# EasyEDA Pro project wzh2814685-voltpen_v0-5-3f4d7379.epro, schematic 主控板原理图
Board Name: 主控板; Create Date: 2025-03-02; Page Name: 原理图; Project Name: 多快充协议多发热芯兼容的诱骗器/焊笔一体化应用工具VoltPen; Schematic Name: 主控板原理图; Update Date: 2025-04-19; Add into BOM: yes; Company: Your Company; Convert to PCB: yes; Date: 2025-03-02; Draw By: weifangluntan; REV: 1.0; Sheet: 1/1
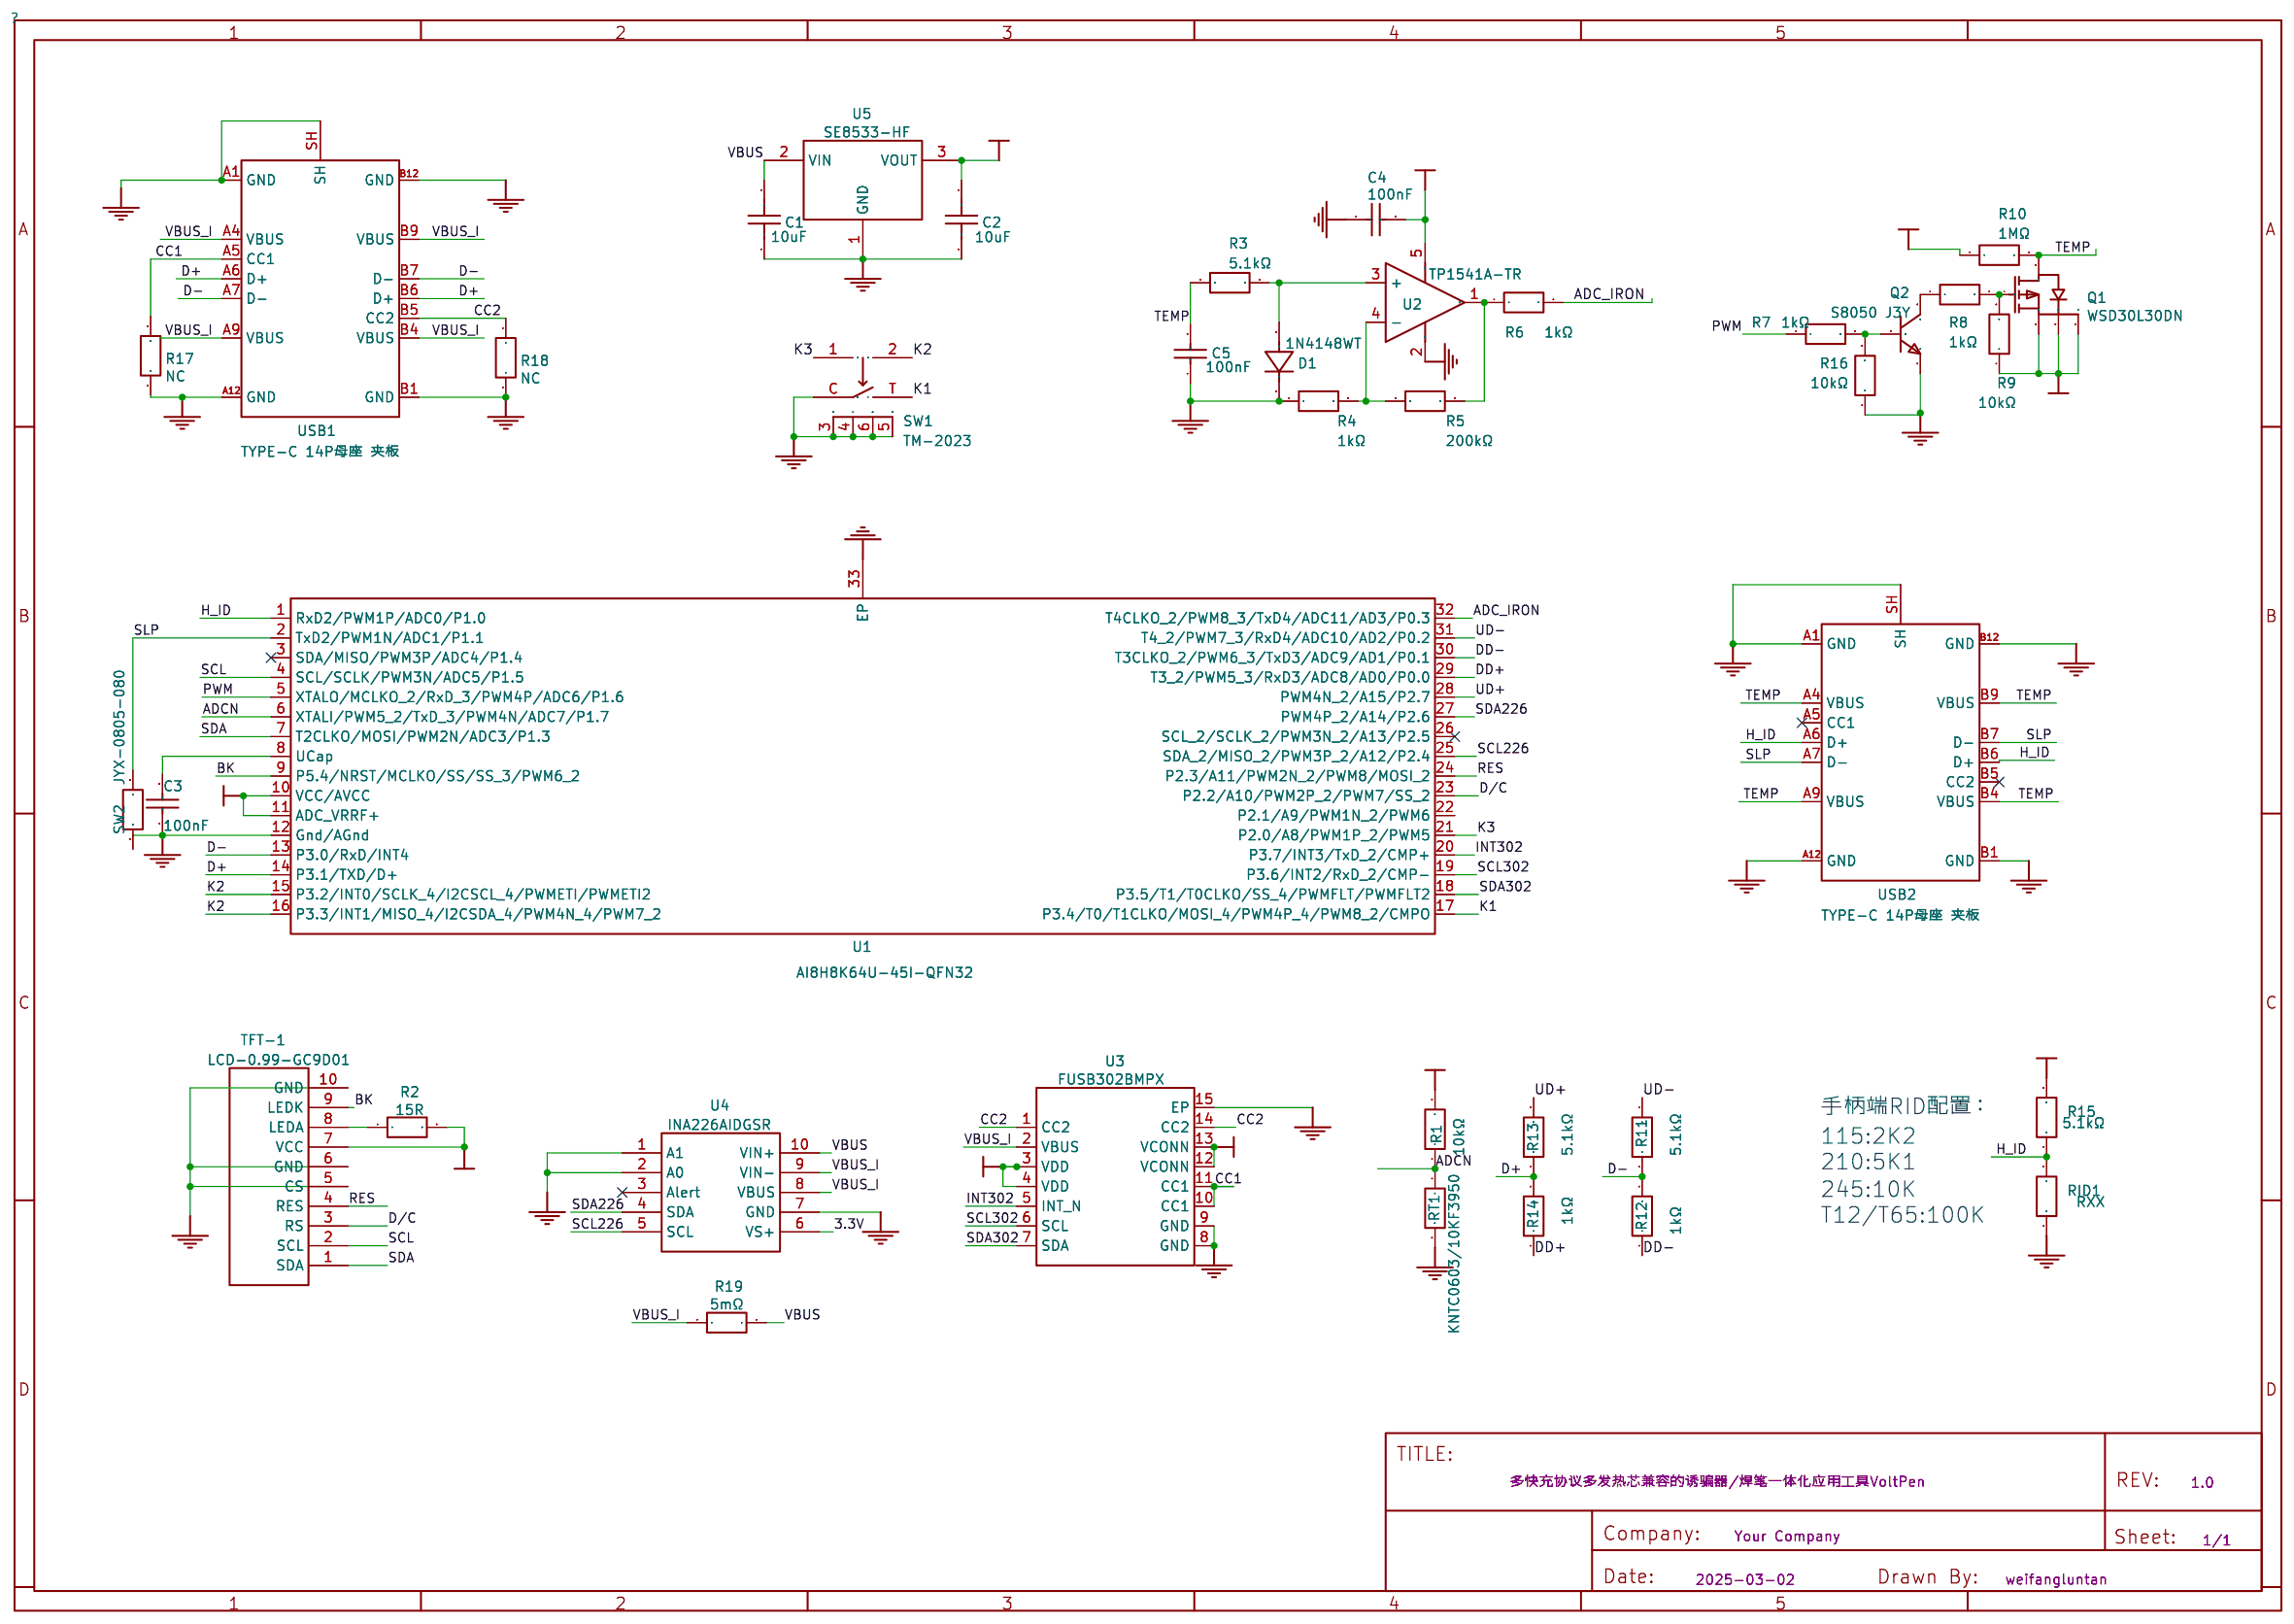
[diagram p0: schematic sheet]

## Parts
C1  10uF  [C0603]
C2  10uF  [C0402]
C3  100nF  [C0402]
C4  100nF  [C0402]
C5  100nF  [C0402]
D1  1N4148WT  [SOD-523_L1.2-W0.8-LS1.6-FD]
Q1  WSD30L30DN  [WDFN-8_L3.3-W3.3-P0.65-BL]
Q2  S8050 J3Y  [SOT-23-3_L2.9-W1.3-P1.90-LS2.4-BR]
R1  10kΩ  [R0402]
R2  15R  [R0402]
R3  5.1kΩ  [R0402]
R4  1kΩ  [R0402]
R5  200kΩ  [R0402]
R6  1kΩ  [R0402]
R7  1kΩ  [R0402]
R8  1kΩ  [R0402]
R9  10kΩ  [R0402]
R10  1MΩ  [R0402]
R11  5.1kΩ  [R0402]
R12  1kΩ  [R0402]
R13  5.1kΩ  [R0402]
R14  1kΩ  [R0402]
R15  5.1kΩ  [R0402]
R16  10kΩ  [R0402]
R17  NC  [R0402]
R18  NC  [R0402]
R19  5mΩ  [R2512]
RID1  RXX  [R0402]  (no BOM)
RT1  KNTC0603/10KF3950  [R0603]
SW1  TM-2023  [SW-SMD_TM-2023-1]
SW2  JYX-0805-080  [R0805]  (no BOM)
TFT-1  LCD-0.99-GC9D01  [0.99寸-GC9D01N]
U1  AI8H8K64U-45I-QFN32  [QFN-32_L4.0-W4.0-P0.40-TL-EP2.7-1]
U2  TP1541A-TR  [SOT-23-5_L3.0-W1.7-P0.95-LS2.8-BR]
U3  FUSB302BMPX  [MLP-14_L2.5-W2.5-P0.50-BL-EP]
U4  INA226AIDGSR  [MSOP-10_L3.0-W3.0-P0.50-LS5.0-BL]
U5  SE8533-HF  [SOT-89-3_L4.5-W2.5-P1.50-LS4.2-BR]
USB1  TYPE-C 14P母座 夹板  [TYPE-C 14P母座]
USB2  TYPE-C 14P母座 夹板  [TYPE-C 14P母座]

## Library data of the parts
C1 = GRM188R6YA106MA73D: 容值:10uF;精度:±20%;额定电压:35V;材质(温度系数):X5R;; LCSC Part Name: 10uF ±20% 35V; Supplier Part: C194427; Manufacturer: muRata(村田); Supplier Footprint: 0603; JLCPCB Part Class: Extended Part; Datasheet: https://atta.szlcsc.com/upload/public/pdf/source/20210128/C194427_FCA3640823207DDB58700A82F1A19B5F.pdf; Supplier: LCSC; Tolerance: ±20%; Voltage Rated: 35V; Temperature Coefficient: X5R
C2 = CL05A106MQ5NUNC: 容值:10uF;精度:±20%;额定电压:6.3V;材质(温度系数):X5R;; LCSC Part Name: 10uF ±20% 6.3V; Supplier Part: C15525; Manufacturer: SAMSUNG(三星); Supplier Footprint: 0402; JLCPCB Part Class: Basic Part; Datasheet: https://atta.szlcsc.com/upload/public/pdf/source/20220823/2B02EE04F8F211D38A52DCB16EB6BEBA.pdf; Supplier: LCSC; Tolerance: ±20%; Voltage Rated: 6.3V; Temperature Coefficient: X5R
C3-C5 = CL05B104KB54PNC: 容值:100nF;精度:±10%;额定电压:50V;材质(温度系数):X7R;; LCSC Part Name: 100nF ±10% 50V; Supplier Part: C307331; Manufacturer: SAMSUNG(三星); Supplier Footprint: 0402; JLCPCB Part Class: Basic Part; Datasheet: https://atta.szlcsc.com/upload/public/pdf/source/20160218/1457707763339.pdf; Supplier: LCSC; Tolerance: ±10%; Voltage Rated: 50V; Temperature Coefficient: X7R
D1 = 1N4148WT_C7420320: 二极管配置:独立式;正向压降(Vf):1.25V@150mA;直流反向耐压(Vr):100V;整流电流:150mA;反向恢复时间(trr):4ns;; Supplier Part: C7420320; Manufacturer: 宏迦橙; Supplier Footprint: SOD-523; JLCPCB Part Class: Extended Part; Datasheet: https://atta.szlcsc.com/upload/public/pdf/source/20231117/D000C709FE20996E10C70AE097E7AADF.pdf; Supplier: LCSC; Diode Configuration: 独立式; Forward Voltage (Vf@If): 1.25V@150mA; Reverse Voltage (Vr): 100V; Rectified Current: 150mA; Reverse Leakage Current (Ir): 1uA@75V; Reverse Recovery Time (trr): 4ns; Operating Temperature: -55℃~+150℃
Q1 = WSD30L30DN: Supplier: LCSC; Supplier Part: C719099; Manufacturer: WINSOK(微硕); Manufacturer Part: WSD30L30DN33; JLCPCB Part Class: Extended Part
Q2 = S8050 J3Y(RANGE:200-350): 晶体管类型:NPN;集电极电流(Ic):500mA;集射极击穿电压(Vceo):25V;耗散功率(Pd):300mW;直流电流增益(hFE):200@500mA,1V;; LCSC Part Name: H档(200-350); Supplier Part: C2146; Manufacturer: CJ(江苏长电/长晶); Supplier Footprint: SOT-23; JLCPCB Part Class: Basic Part; Datasheet: https://atta.szlcsc.com/upload/public/pdf/source/20231013/FF37B6A000E6CDA75C9C999D2E78731F.pdf; Supplier: LCSC; type: NPN; Current - Collector(Ic): 500mA; Collector - Emitter Voltage VCEO: 25V; Pd - Power Dissipation: 300mW; DC Current Gain: 200@500mA,1V; Transition frequency(fT): 150MHz; Current - Collector Cutoff: 100nA; Vce Saturation(VCE(sat)): 600mV; Operating Temperature: -55℃~+150℃
R1 R9 R16 = 0402WGF1002TCE: 电阻类型:厚膜电阻;阻值:10kΩ;精度:±1%;功率:62.5mW;最大工作电压:50V;温度系数:±100ppm/℃;; LCSC Part Name: 10kΩ ±1% 62.5mW 厚膜电阻; Supplier Part: C25744; Manufacturer: UNI-ROYAL(厚声); Supplier Footprint: 0402; JLCPCB Part Class: Basic Part; Datasheet: https://atta.szlcsc.com/upload/public/pdf/source/20200306/C422600_1E6D84923E4A46A82E41ADD87F860B5C.pdf; Supplier: LCSC; Type: 厚膜电阻; Tolerance: ±1%; Power(Watts): 62.5mW; Overload Voltage (Max): 50V; Temperature Coefficient: ±100ppm/℃; Operating Temperature Range: -55℃~+155℃
R2 = 15R
R3 R11 R13 R15 R17 R18 = 0402WGF5101TCE: 电阻类型:厚膜电阻;阻值:5.1kΩ;精度:±1%;功率:62.5mW;最大工作电压:50V;温度系数:±100ppm/℃;; LCSC Part Name: 5.1kΩ ±1% 62.5mW 厚膜电阻; Supplier Part: C25905; Manufacturer: UNI-ROYAL(厚声); Supplier Footprint: 0402; JLCPCB Part Class: Basic Part; Datasheet: https://atta.szlcsc.com/upload/public/pdf/source/20200306/C422600_1E6D84923E4A46A82E41ADD87F860B5C.pdf; Supplier: LCSC; Type: 厚膜电阻; Tolerance: ±1%; Power(Watts): 62.5mW; Overload Voltage (Max): 50V; Temperature Coefficient: ±100ppm/℃; Operating Temperature Range: -55℃~+155℃
R4 R6-R8 R12 R14 = 0402WGF1001TCE: 电阻类型:厚膜电阻;阻值:1kΩ;精度:±1%;功率:62.5mW;最大工作电压:50V;温度系数:±100ppm/℃;; LCSC Part Name: 1kΩ ±1% 62.5mW 厚膜电阻; Supplier Part: C11702; Manufacturer: UNI-ROYAL(厚声); Supplier Footprint: 0402; JLCPCB Part Class: Basic Part; Datasheet: https://atta.szlcsc.com/upload/public/pdf/source/20200306/C422600_1E6D84923E4A46A82E41ADD87F860B5C.pdf; Supplier: LCSC; Type: 厚膜电阻; Tolerance: ±1%; Power(Watts): 62.5mW; Overload Voltage (Max): 50V; Temperature Coefficient: ±100ppm/℃; Operating Temperature Range: -55℃~+155℃
R5 = 0402WGF2003TCE: 电阻类型:厚膜电阻;阻值:200kΩ;精度:±1%;功率:62.5mW;最大工作电压:50V;温度系数:±100ppm/℃;; LCSC Part Name: 200kΩ ±1% 62.5mW 厚膜电阻; Supplier Part: C25764; Manufacturer: UNI-ROYAL(厚声); Supplier Footprint: 0402; JLCPCB Part Class: Basic Part; Datasheet: https://atta.szlcsc.com/upload/public/pdf/source/20200306/C422600_1E6D84923E4A46A82E41ADD87F860B5C.pdf; Supplier: LCSC; Type: 厚膜电阻; Tolerance: ±1%; Power(Watts): 62.5mW; Overload Voltage (Max): 50V; Temperature Coefficient: ±100ppm/℃; Operating Temperature Range: -55℃~+155℃
R10 = 0402WGF1004TCE: 电阻类型:厚膜电阻;阻值:1MΩ;精度:±1%;功率:62.5mW;最大工作电压:50V;温度系数:±100ppm/℃;; LCSC Part Name: 1MΩ ±1% 62.5mW 厚膜电阻; Supplier Part: C26083; Manufacturer: UNI-ROYAL(厚声); Supplier Footprint: 0402; JLCPCB Part Class: Basic Part; Datasheet: https://atta.szlcsc.com/upload/public/pdf/source/20200306/C422600_1E6D84923E4A46A82E41ADD87F860B5C.pdf; Supplier: LCSC; Type: 厚膜电阻; Tolerance: ±1%; Power(Watts): 62.5mW; Overload Voltage (Max): 50V; Temperature Coefficient: ±100ppm/℃; Operating Temperature Range: -55℃~+155℃
R19 = 5mΩ: Supplier: LCSC; Supplier Part: C2912763; Manufacturer: Milliohm(毫欧); Manufacturer Part: HoRS2512-1W-30mR-1%; JLCPCB Part Class: Extended Part
RID1 = RXX
RT1 = KNTC0603/10KF3950: 阻值:10kΩ;B值(25℃/50℃):3950K;功率:100mW;B值精度:±1%;最大稳态电流(25℃):310uA;; Supplier Part: C2892547; Manufacturer: KUU; Supplier Footprint: 0603; JLCPCB Part Class: Extended Part; Datasheet: https://atta.szlcsc.com/upload/public/pdf/source/20210908/154E92DD1F52D9B3804AA862EC2D5FAB.pdf; Supplier: LCSC; Resistance @ 25℃: 10kΩ; B Constant (25℃/50℃): 3950K; B Constant (25℃/85℃): 3987K; Power(Watts): 100mW; B Constant Tolerance: ±1%; Steady State Current (Max): 310uA; Operating Temperature: -40℃~+125℃
SW1 = TM-2023: Supplier: LCSC; Supplier Part: C318951; Manufacturer: XKB Enterprise; JLCPCB Part Class: Extended Part
SW2 = JYX-0805-080
TFT-1 = LCD-0.99-GC9D01
U1 = AI8H8K64U-45I-QFN32: USB/四组串口/USB直接仿真/下载; Supplier Part: C41427633; Manufacturer: STC; Supplier Footprint: QFN-32; JLCPCB Part Class: Extended Part; Datasheet: https://atta.szlcsc.com/upload/public/pdf/source/20241125/D829C6BEAA790EB7414E40DF632E5631.pdf; Supplier: LCSC
U2 = TP1541A-TR: Supplier: LCSC; Manufacturer: 3PEAK; Supplier Part: C99007; JLCPCB Part Class: Extended Part
U3 = FUSB302BMPX: 应用功能:控制器;接口协议:-;; LCSC Part Name: 可编程USB Type-C控制器带PD功能; Supplier Part: C132291; Manufacturer: onsemi(安森美); Supplier Footprint: WFQFN-14(2.5x2.5); JLCPCB Part Class: Extended Part; Datasheet: https://atta.szlcsc.com/upload/public/pdf/source/20170925/C132291_1506321679858990471.pdf; Supplier: LCSC; Applications Function: 控制器; Supply Voltage: 2.8V~5.5V; Operating Temperature: -40℃~+125℃
U4 = INA226AIDGSR: Supplier: LCSC; Manufacturer: TI(德州仪器); Supplier Part: C49851; JLCPCB Part Class: Extended Part
U5 = SE8533-HF: Supplier: LCSC; Manufacturer: SEAWARD(思旺); Manufacturer Part: SE8533K2-HF; Supplier Part: C115013; JLCPCB Part Class: Extended Part
USB1 USB2 = TYPE-C 14P母座 夹板

## Nets
3.3V: C2.1 C4.2 R1.2 R2.2 R10.1 R15.2 TFT-1.7(VCC) U1.10(VCC/AVCC) U1.11(ADC_VRRF+) U2.5(VCC+) U3.3(VDD) U3.4(VDD) U3.12(VCONN) U3.13(VCONN) U4.6(VS+) U5.3(VOUT)
GND: C1.2 C2.2 C3.1 C4.1 C5.1 D1.1(K) Q2.2(E) R4.1 R16.1 R17.2 R18.2 RID1.1 RT1.2 SW1.3 SW1.4 SW1.5 SW1.6 SW1.C SW2.2 TFT-1.5(CS) TFT-1.6(GND) TFT-1.10(GND) U1.12(Gnd/AGnd) U1.33(EP) U2.2(GND) U3.8(GND) U3.9(GND) U3.15(EP) U4.1(A1) U4.2(A0) U4.7(GND) U5.1(GND) USB1.A1(GND) USB1.A12(GND) USB1.B1(GND) USB1.B12(GND) USB1.SH USB2.A1(GND) USB2.A12(GND) USB2.B1(GND) USB2.B12(GND) USB2.SH
VBUS: C1.1 Q1.1(S) Q1.2(S) Q1.3(S) R9.1 R19.2 U4.10(VIN+) U5.2(VIN)
VBUS_I: R19.1 U3.2(VBUS) U4.8(VBUS) U4.9(VIN-) USB1.A4(VBUS) USB1.A9(VBUS) USB1.B4(VBUS) USB1.B9(VBUS)
ADC_IRON: R6.2 U1.32(T4CLKO_2/PWM8_3/TxD4/ADC11/AD3/P0.3)
ADCN: R1.1 RT1.1 U1.6(XTALI/PWM5_2/TxD_3/PWM4N/ADC7/P1.7)
BK: TFT-1.9(LEDK) U1.9(P5.4/NRST/MCLKO/SS/SS_3/PWM6_2)
CC1: R17.1 U3.10(CC1) U3.11(CC1) USB1.A5(CC1)
CC2: R18.1 U3.1(CC2) U3.14(CC2) USB1.B5(CC2)
D+: R13.1 R14.2 U1.14(P3.1/TXD/D+) USB1.A6(D+) USB1.B6(D+)
D-: R11.1 R12.2 U1.13(P3.0/RxD/INT4) USB1.A7(D-) USB1.B7(D-)
D/C: TFT-1.3(RS) U1.23(P2.2/A10/PWM2P_2/PWM7/SS_2)
DD+: R14.1 U1.29(T3_2/PWM5_3/RxD3/ADC8/AD0/P0.0)
DD-: R12.1 U1.30(T3CLKO_2/PWM6_3/TxD3/ADC9/AD1/P0.1)
H_ID: R15.1 RID1.2 U1.1(RxD2/PWM1P/ADC0/P1.0) USB2.A6(D+) USB2.B6(D+)
INT302: U1.20(P3.7/INT3/TxD_2/CMP+) U3.5(INT_N)
K1: SW1.T U1.17(P3.4/T0/T1CLKO/MOSI_4/PWM4P_4/PWM8_2/CMPO)
K2: SW1.2 U1.15(P3.2/INT0/SCLK_4/I2CSCL_4/PWMETI/PWMETI2) U1.16(P3.3/INT1/MISO_4/I2CSDA_4/PWM4N_4/PWM7_2)
K3: SW1.1 U1.21(P2.0/A8/PWM1P_2/PWM5)
PWM: R7.1 U1.5(XTALO/MCLKO_2/RxD_3/PWM4P/ADC6/P1.6)
RES: TFT-1.4(RES) U1.24(P2.3/A11/PWM2N_2/PWM8/MOSI_2)
SCL: TFT-1.2(SCL) U1.4(SCL/SCLK/PWM3N/ADC5/P1.5)
SCL226: U1.25(SDA_2/MISO_2/PWM3P_2/A12/P2.4) U4.5(SCL)
SCL302: U1.19(P3.6/INT2/RxD_2/CMP-) U3.6(SCL)
SDA: TFT-1.1(SDA) U1.7(T2CLKO/MOSI/PWM2N/ADC3/P1.3)
SDA226: U1.27(PWM4P_2/A14/P2.6) U4.4(SDA)
SDA302: U1.18(P3.5/T1/T0CLKO/SS_4/PWMFLT/PWMFLT2) U3.7(SDA)
SLP: SW2.1 U1.2(TxD2/PWM1N/ADC1/P1.1) USB2.A7(D-) USB2.B7(D-)
TEMP: C5.2 Q1.5(D) R3.1 R10.2 USB2.A4(VBUS) USB2.A9(VBUS) USB2.B4(VBUS) USB2.B9(VBUS)
UD+: R13.2 U1.28(PWM4N_2/A15/P2.7)
UD-: R11.2 U1.31(T4_2/PWM7_3/RxD4/ADC10/AD2/P0.2)
$1N32: R2.1 TFT-1.8(LEDA)
$1N39: C3.2 U1.8(UCap)
$1N64: R5.2 R6.1 U2.1(OUT)
$1N65: R4.2 R5.1 U2.4(-)
$1N66: D1.2(A) R3.2 U2.3(+)
$1N74: Q2.1(B) R7.2 R16.2
$1N893: Q2.3(C) R8.1
$1N902: Q1.4(G) R8.2 R9.2

Not connected (* = marked no-connect by the designer): U1 3(SDA/MISO/PWM3P/ADC4/P1.4)* 22(P2.1/A9/PWM1N_2/PWM6) 26(SCL_2/SCLK_2/PWM3N_2/A13/P2.5)*; U4 3(Alert)*; USB2 A5(CC1)* B5(CC2)*

## Notes on the sheet
- 手柄端RID配置：
- 115:2K2
- 210:5K1
- 245:10K
- T12/T65:100K
